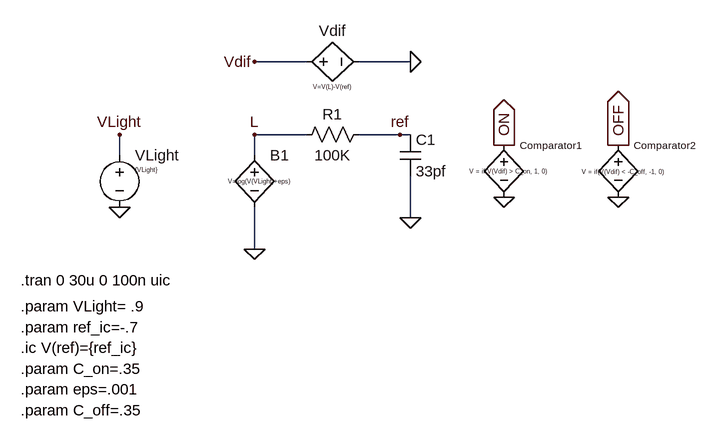
[diagram p0: schematic DVS_Pixel.asc]
DVS_Pixel.asc, the LTspice schematic file:
Version 4
SHEET 1 1628 680
WIRE 688 64 608 64
WIRE 848 64 768 64
WIRE 688 176 608 176
WIRE 832 176 768 176
WIRE 848 176 832 176
WIRE 400 208 400 176
WIRE 608 208 608 176
WIRE 848 304 848 240
WIRE 608 352 608 288
FLAG 608 352 0
FLAG 400 288 0
FLAG 608 176 L
FLAG 832 176 ref
FLAG 848 304 0
FLAG 992 272 0
FLAG 1168 272 0
FLAG 992 192 ON
IOPIN 992 192 Out
FLAG 1168 192 OFF
IOPIN 1168 192 Out
FLAG 848 64 0
FLAG 608 64 Vdif
FLAG 400 176 VLight
SYMBOL Voltage 400 192 R0
WINDOW 3 24 38 Left 0
SYMATTR Value {VLight}
SYMATTR InstName VLight
SYMBOL bv 608 192 R0
WINDOW 3 -41 56 Left 0
SYMATTR Value V=log(V(VLight)+eps)
SYMATTR InstName B1
SYMBOL Res 672 192 R270
WINDOW 0 32 56 VTop 2
WINDOW 3 0 56 VBottom 2
SYMATTR InstName R1
SYMATTR Value 100K
SYMBOL Cap 832 176 R0
SYMATTR InstName C1
SYMATTR Value 33pf
SYMBOL bv 672 64 R270
WINDOW 0 32 56 VTop 2
WINDOW 3 -32 56 VBottom 0
SYMATTR InstName Vdif
SYMATTR Value V=V(L)-V(ref)
SYMBOL bv 992 176 R0
WINDOW 0 24 16 Left 1
WINDOW 3 6 63 Bottom 0
SYMATTR InstName Comparator1
SYMATTR Value V = if(V(Vdif) > C_on, 1, 0)
SYMBOL bv 1168 176 R0
WINDOW 0 24 16 Left 1
WINDOW 3 -56 57 Left 0
SYMATTR InstName Comparator2
SYMATTR Value V = if(V(Vdif) < -C_off, -1, 0)
TEXT 248 400 Left 2 !.tran 0 30u 0 100n uic
TEXT 248 440 Left 2 !.param VLight= .9
TEXT 248 472 Left 2 !.param ref_ic=-.7
TEXT 248 504 Left 2 !.ic V(ref)={ref_ic}
TEXT 248 536 Left 2 !.param C_on=.35
TEXT 248 568 Left 2 !.param eps=.001
TEXT 248 600 Left 2 !.param C_off=.35

The netlist it stands for:
* DVS_Pixel.asc
VLight VLight 0 {VLight}
B1 L 0 V=log(V(VLight)+eps)
R1 L ref 100K
C1 ref 0 33pf
B§Vdif Vdif 0 V=V(L)-V(ref)
B§Comparator1 ON 0 V = if(V(Vdif) > C_on, 1, 0)
B§Comparator2 OFF 0 V = if(V(Vdif) < -C_off, -1, 0)
.tran 0 30u 0 100n uic
.param VLight= .9
.param ref_ic=-.7
.ic V(ref)={ref_ic}
.param C_on=.35
.param eps=.001
.param C_off=.35
.backanno
.end